# Altium schematic sheet 02_Controller_IO.SchDoc
size 406 x 279 mm
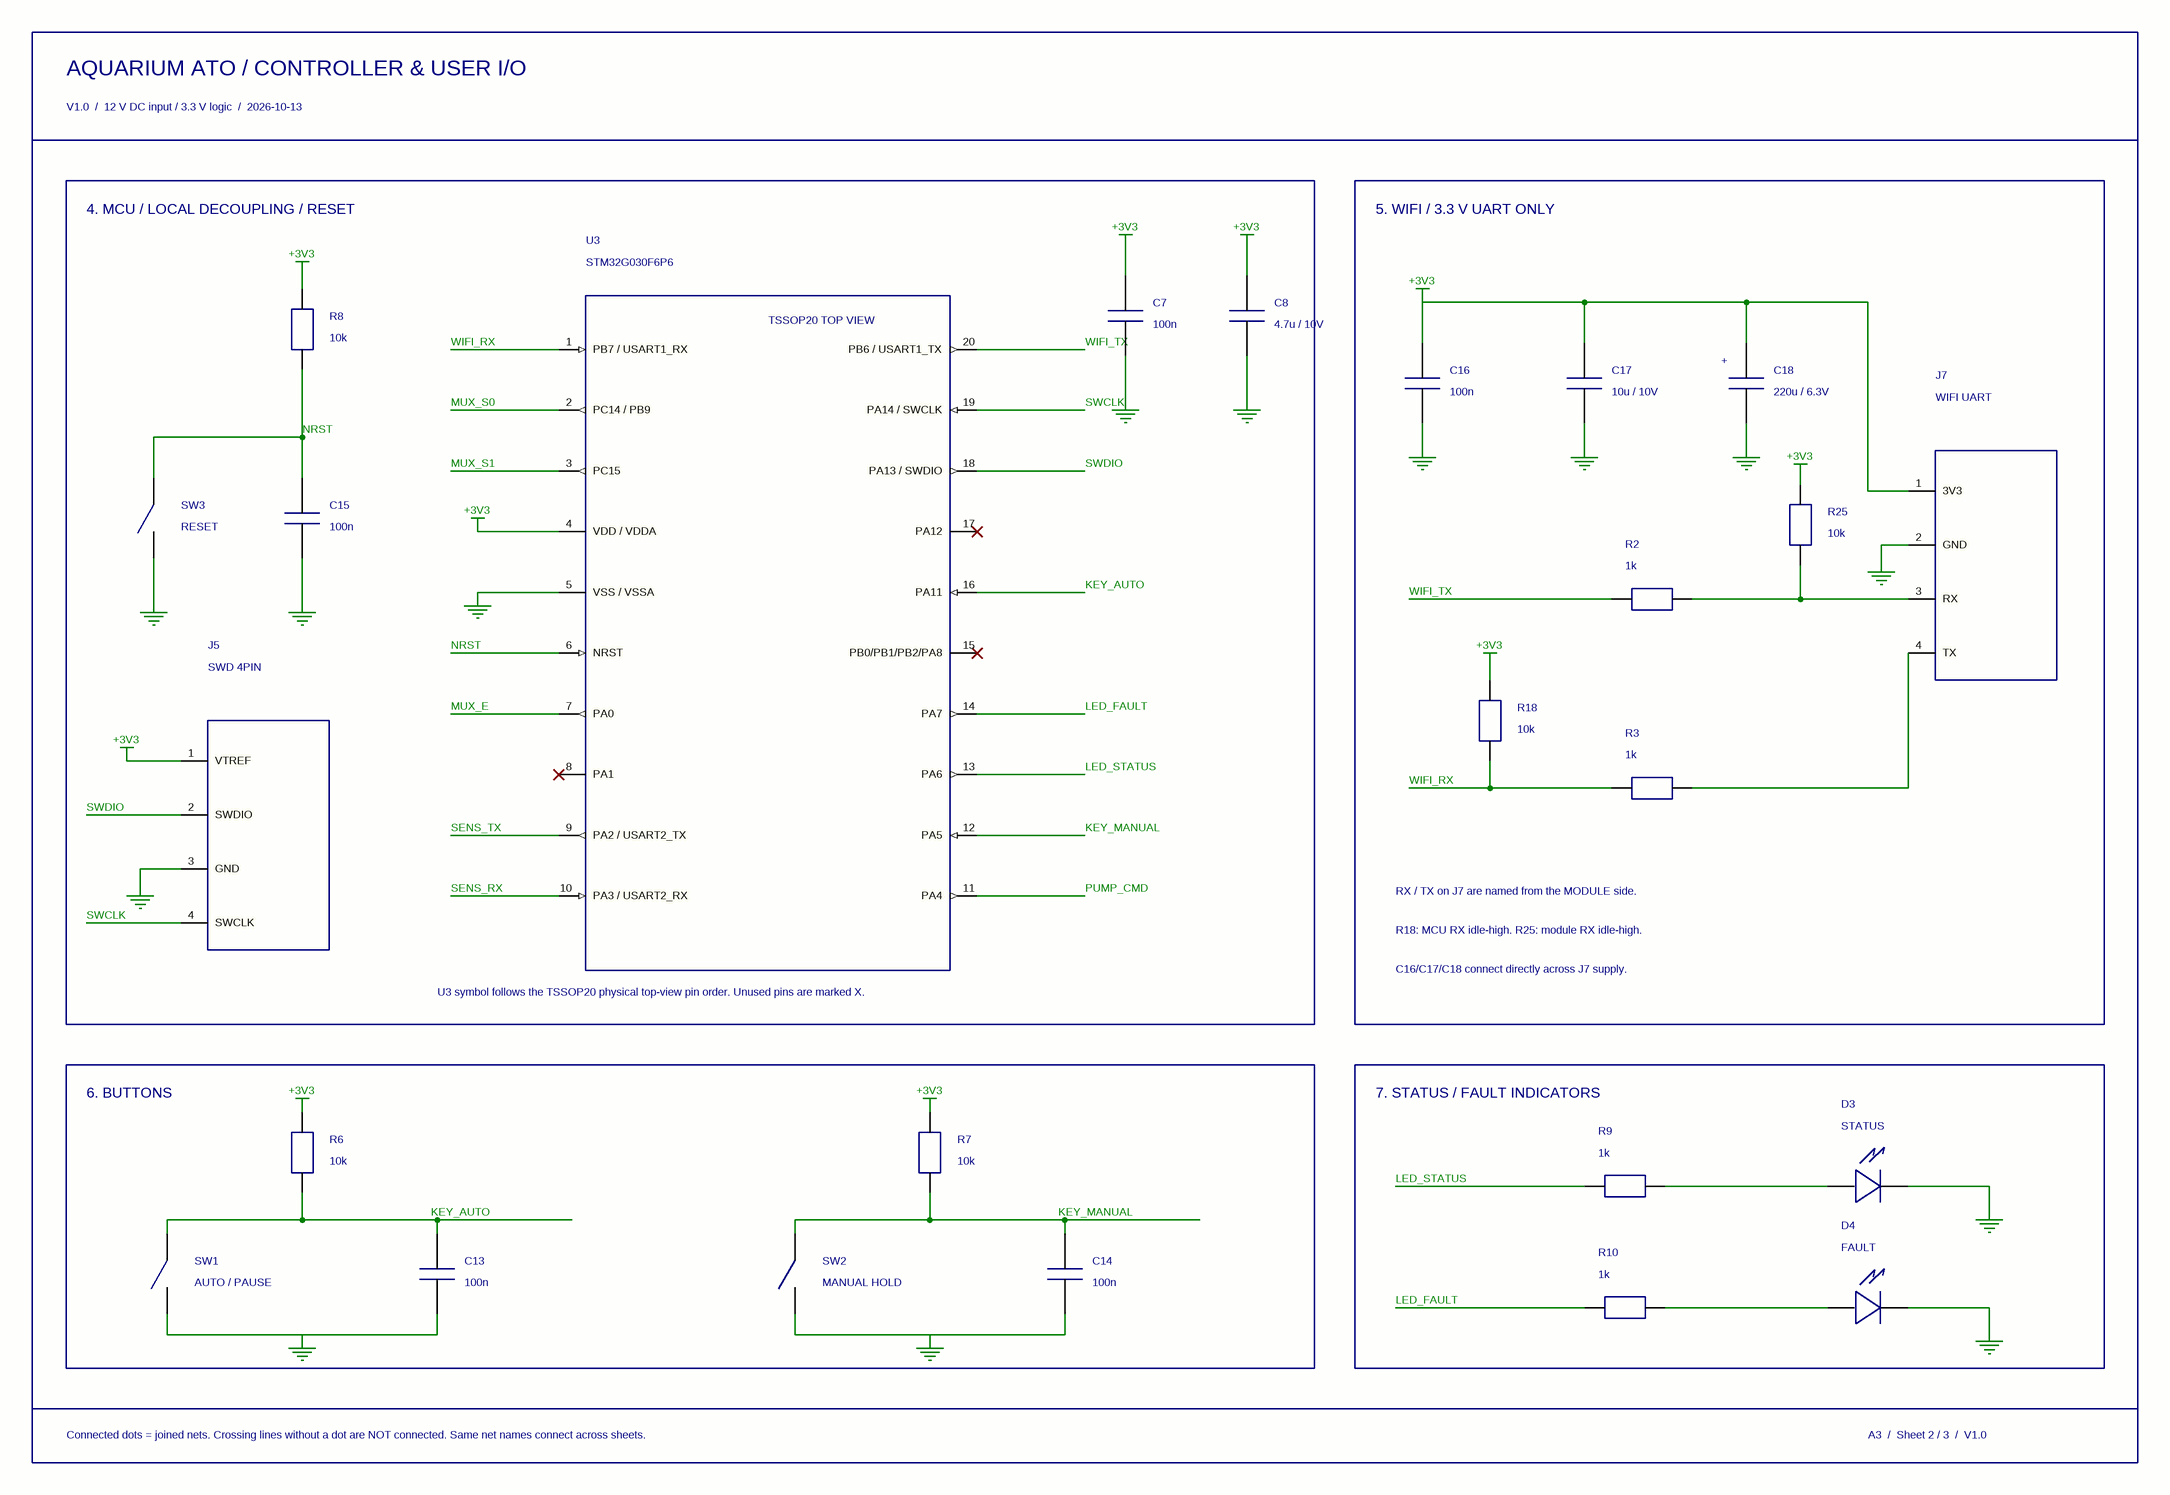
[diagram p0: 02_Controller_IO.SchDoc]

## Parts
C7  100n  [C_0603_1608Metric]
C8  4.7u / 10V  [C_0805_2012Metric]
C13  100n  [C_0603_1608Metric]
C14  100n  [C_0603_1608Metric]
C15  100n  [C_0603_1608Metric]
C16  100n  [C_0603_1608Metric]
C17  10u / 10V  [C_0805_2012Metric]
C18  220u / 6.3V  [CP_RADIAL_D8.0_P3.50]
D3  STATUS  [LED_0603_1608Metric]
D4  FAULT  [LED_0603_1608Metric]
J5  SWD 4PIN  [HDR_1x4_P2.54]
J7  WIFI UART  [HDR_1x4_P2.54]
R2  1k  [R_0603_1608Metric]
R3  1k  [R_0603_1608Metric]
R6  10k  [R_0603_1608Metric]
R7  10k  [R_0603_1608Metric]
R8  10k  [R_0603_1608Metric]
R9  1k  [R_0603_1608Metric]
R10  1k  [R_0603_1608Metric]
R18  10k  [R_0603_1608Metric]
R25  10k  [R_0603_1608Metric]
SW1  AUTO / PAUSE  [SW_TACT_6x6_4P]
SW2  MANUAL HOLD  [SW_TACT_6x6_4P]
SW3  RESET  [SW_TACT_6x6_4P]
U3  STM32G030F6P6  [TSSOP-20_P0.65]

## Blocks framed on the sheet
4. MCU / LOCAL DECOUPLING / RESET: C7 C8 C15 J5 R8 SW3 U3
5. WIFI / 3.3 V UART ONLY: C16-C18 J7 R2 R3 R18 R25
6. BUTTONS: C13 C14 R6 R7 SW1 SW2
7. STATUS / FAULT INDICATORS: D3 D4 R9 R10

## Nets
+3V3: C7.1 C8.1 C16.1 C17.1 C18.1 J5.1(VTREF) J7.1(3V3) R6.1 R7.1 R8.1 R18.1 R25.1 U3.4(VDD_/_VDDA)
GND: C7.2 C8.2 C13.2 C14.2 C15.2 C16.2 C17.2 C18.2 D3.1(K) D4.1(K) J5.3(GND) J7.2(GND) SW1.2 SW2.2 SW3.2 U3.5(VSS_/_VSSA)
KEY_AUTO: C13.1 R6.2 SW1.1 U3.16(PA11)
KEY_MANUAL: C14.1 R7.2 SW2.1 U3.12(PA5)
LED_FAULT: R10.1 U3.14(PA7)
LED_STATUS: R9.1 U3.13(PA6)
MUX_E: U3.7(PA0)
MUX_S0: U3.2(PC14_/_PB9)
MUX_S1: U3.3(PC15)
NRST: C15.1 R8.2 SW3.1 U3.6(NRST)
PUMP_CMD: U3.11(PA4)
SENS_RX: U3.10(PA3_/_USART2_RX)
SENS_TX: U3.9(PA2_/_USART2_TX)
SWCLK: J5.4(SWCLK) U3.19(PA14_/_SWCLK)
SWDIO: J5.2(SWDIO) U3.18(PA13_/_SWDIO)
WIFI_RX: R3.1 R18.2 U3.1(PB7_/_USART1_RX)
WIFI_TX: R2.1 U3.20(PB6_/_USART1_TX)
NetD3_2: D3.2(A) R9.2
NetD4_2: D4.2(A) R10.2
NetJ7_3: J7.3(RX) R2.2 R25.2
NetJ7_4: J7.4(TX) R3.2

Not connected (* = marked no-connect by the designer): U3 8(PA1)* 15(PB0/PB1/PB2/PA8)* 17(PA12)*

## Notes on the sheet
- AQUARIUM ATO / CONTROLLER & USER I/O
- V1.0  /  12 V DC input / 3.3 V logic  /  2026-10-13
- RX / TX on J7 are named from the MODULE side.
- R18: MCU RX idle-high. R25: module RX idle-high.
- C16/C17/C18 connect directly across J7 supply.
- U3 symbol follows the TSSOP20 physical top-view pin order. Unused pins are marked X.
- Connected dots = joined nets. Crossing lines without a dot are NOT connected. Same net names connect across sheets.
- A3  /  Sheet 2 / 3  /  V1.0
- (in symbol CAPACITOR_POLARIZED_RADIAL) +
- (in symbol STM32G030F6P6) TSSOP20 TOP VIEW

## Library data of the parts
C7 C13-C16 = CAPACITOR_C_0603_1608METRIC: 100n; footprint C_0603_1608Metric
C8 = CAPACITOR_C_0805_2012METRIC: 4.7u / 10V; footprint C_0805_2012Metric
C17 = CAPACITOR_C_0805_2012METRIC: 10u / 10V; footprint C_0805_2012Metric
C18 = CAPACITOR_POLARIZED_RADIAL: 220u / 6.3V; footprint CP_RADIAL_D8.0_P3.50
D3 = LED_0603: STATUS; footprint LED_0603_1608Metric
D4 = LED_0603: FAULT; footprint LED_0603_1608Metric
J5 = SWD_4P: SWD 4PIN; footprint HDR_1x4_P2.54
J7 = WIFI_UART_4P: WIFI UART; footprint HDR_1x4_P2.54
R2 R3 R9 R10 = RESISTOR_0603: 1k; footprint R_0603_1608Metric
R6-R8 R18 R25 = RESISTOR_0603: 10k; footprint R_0603_1608Metric
SW1 = SWITCH_TACT_6X6: AUTO / PAUSE; footprint SW_TACT_6x6_4P
SW2 = SWITCH_TACT_6X6: MANUAL HOLD; footprint SW_TACT_6x6_4P
SW3 = SWITCH_TACT_6X6: RESET; footprint SW_TACT_6x6_4P
U3 = STM32G030F6P6: STM32G030F6P6; package TSSOP20; footprint TSSOP-20_P0.65